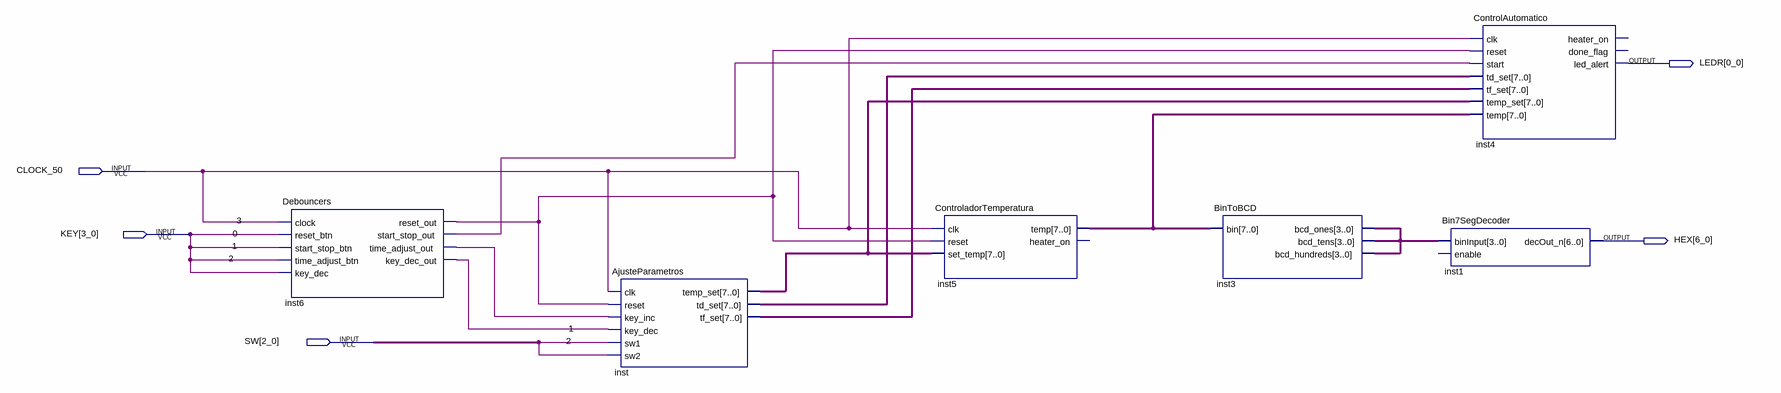
[diagram p0: schematic sheet]
// Quartus schematic Projetolsd.bdf as structural Verilog: 6 symbols, 5 pins
module Projetolsd (
  input  CLOCK_50,
  input  \KEY[3_0] ,
  input  \SW[2_0] ,
  output \LEDR[0_0] ,
  output \HEX[6_0] 
);

  wire inst6_key_dec_out, inst6_reset_out, inst6_start_stop_out, inst6_time_adjust_out;
  wire [3:0] inst3_bcd_ones;
  wire [7:0] inst5_temp, inst_td_set, inst_temp_set, inst_tf_set;

  Debouncers inst6 (
    .clock(CLOCK_50), .reset_btn(\KEY[3_0] ), .start_stop_btn(\KEY[3_0] ), .time_adjust_btn(\KEY[3_0] ),
    .key_dec(\KEY[3_0] ), .reset_out(inst6_reset_out), .start_stop_out(inst6_start_stop_out),
    .time_adjust_out(inst6_time_adjust_out), .key_dec_out(inst6_key_dec_out));
  AjusteParametros inst (
    .clk(CLOCK_50), .reset(inst6_reset_out), .key_inc(inst6_time_adjust_out), .key_dec(inst6_key_dec_out),
    .sw1(\KEY[3_0] ), .sw2(\KEY[3_0] ), .temp_set(inst_temp_set), .td_set(inst_td_set), .tf_set(inst_tf_set));
  ControladorTemperatura inst5 (
    .clk(CLOCK_50), .reset(inst6_reset_out), .set_temp(inst_temp_set), .temp(inst5_temp));  // open: heater_on
  BinToBCD inst3 (
    .bin(inst5_temp), .bcd_ones(inst3_bcd_ones), .bcd_tens(inst3_bcd_ones), .bcd_hundreds(inst3_bcd_ones));
  Bin7SegDecoder inst1 (.binInput(inst3_bcd_ones), .decOut_n(\HEX[6_0] ));  // open: enable
  ControlAutomatico inst4 (
    .clk(CLOCK_50), .reset(inst6_reset_out), .start(inst6_start_stop_out), .td_set(inst_td_set),
    .tf_set(inst_tf_set), .temp_set(inst_temp_set), .temp(inst5_temp), .led_alert(\LEDR[0_0] ));  // open: heater_on, done_flag

  // Other names for the same wires on the sheet: 0 = \KEY[3_0] ; 1 = \KEY[3_0] ; 2 = \KEY[3_0] ; 3 = \KEY[3_0] 
endmodule
